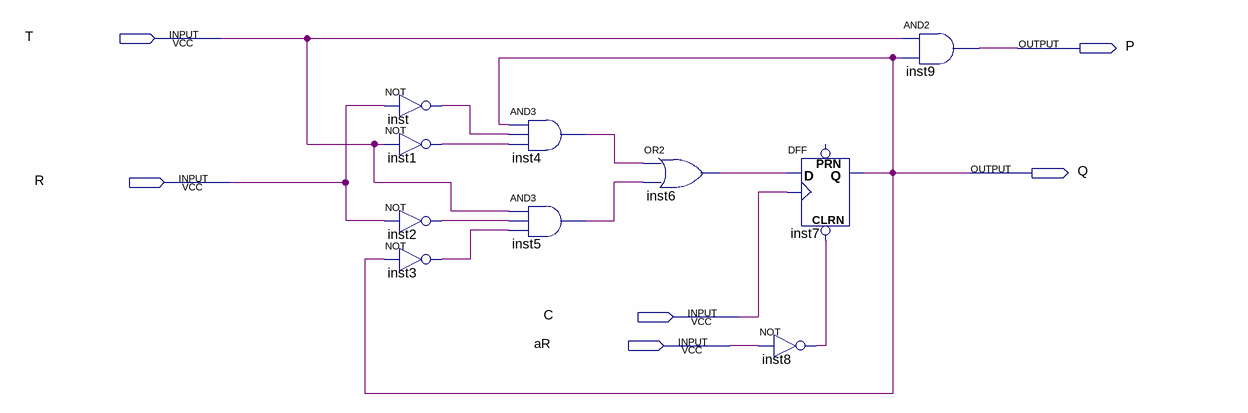
[diagram p0: schematic sheet]
// Quartus schematic CT11EB.bdf as structural Verilog: 10 symbols, 6 pins
module CT11EB (
  input  T,
  input  R,
  input  C,
  input  aR,
  output P,
  output Q
);

  wire inst1_out, inst2_out, inst3_out, inst4_out, inst5_out, inst6_out, inst8_out, inst_out;

  not inst (inst_out, R);
  not inst1 (inst1_out, T);
  not inst2 (inst2_out, R);
  not inst3 (inst3_out, Q);
  and inst4 (inst4_out, Q, inst_out, inst1_out);
  and inst5 (inst5_out, T, inst2_out, inst3_out);
  or inst6 (inst6_out, inst4_out, inst5_out);
  not inst8 (inst8_out, aR);
  DFF inst7 (.CLRN(inst8_out), .CLK(C), .D(inst6_out), .Q(Q));  // open: PRN
  and inst9 (P, T, Q);
endmodule
